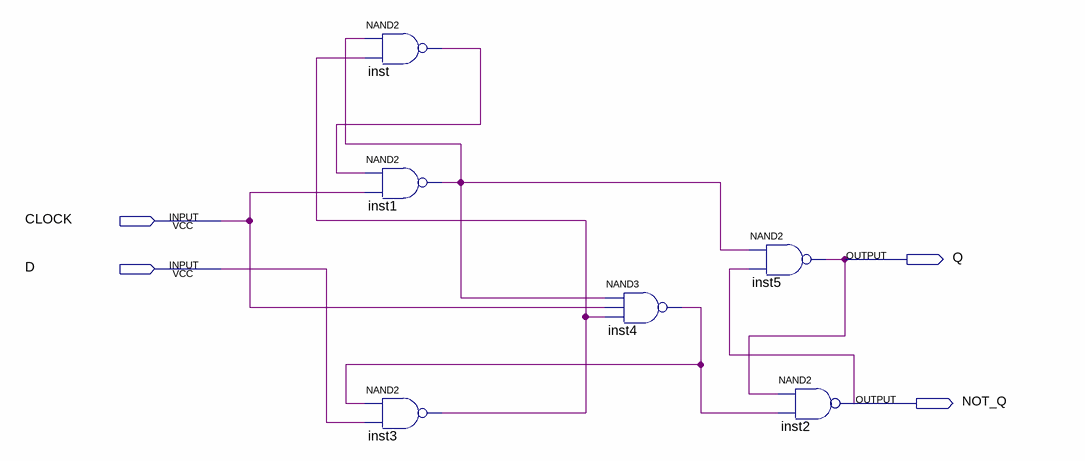
[diagram p0: schematic sheet]
// Quartus schematic flip_flop_tipoD.bdf as structural Verilog: 6 symbols, 4 pins
module flip_flop_tipoD (
  input  CLOCK,
  input  D,
  output Q,
  output NOT_Q
);

  wire inst1_out, inst3_out, inst4_out, inst_out;

  nand inst (inst_out, inst1_out, inst3_out);
  nand inst1 (inst1_out, inst_out, CLOCK);
  nand inst3 (inst3_out, inst4_out, D);
  nand inst4 (inst4_out, inst1_out, CLOCK, inst3_out);
  nand inst5 (Q, inst1_out, NOT_Q);
  nand inst2 (NOT_Q, Q, inst4_out);
endmodule
